# Altium schematic sheet Top_Level.SchDoc
size A4; SheetNumber: 1; SheetTotal: 7
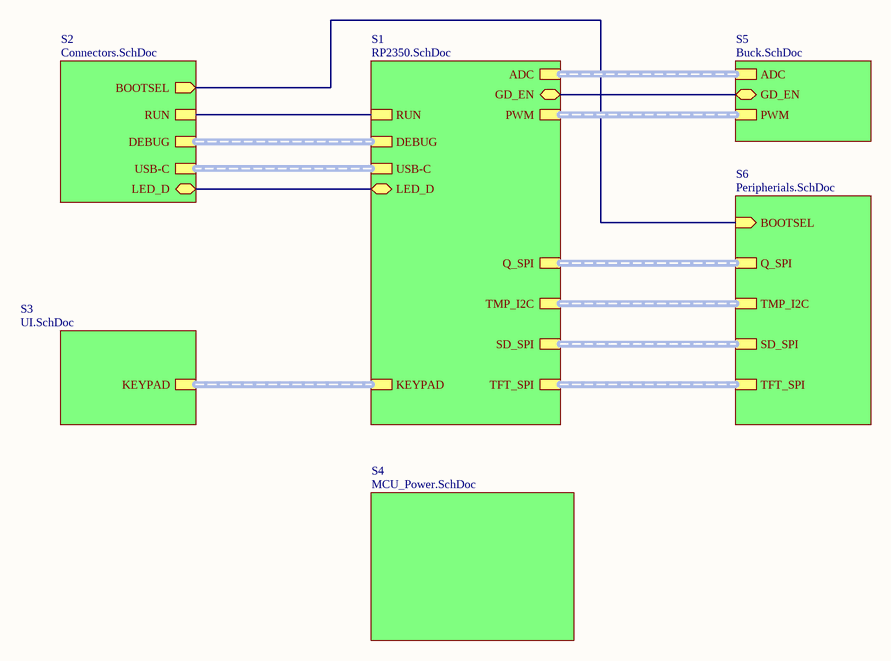
[diagram p0: Top_Level.SchDoc]

## Sub-sheets
S1 = RP2350.SchDoc: ADC (harness ADC), KEYPAD (harness KEYPAD), PWM (harness PWM), Q_SPI (harness Q_SPI), TMP_I2C (harness TMP_I2C), SD_SPI (harness SD_CARD), TFT_SPI (harness TFT_SPI), USB-C (harness USB-C), DEBUG (harness DEBUG), RUN, GD_EN (bidir), LED_D (bidir)
S2 = Connectors.SchDoc: USB-C (harness USB-C), DEBUG (harness DEBUG), RUN, BOOTSEL (out), LED_D (bidir)
S3 = UI.SchDoc: KEYPAD (harness KEYPAD)
S4 = MCU_Power.SchDoc: no entries
S5 = Buck.SchDoc: ADC (harness ADC), PWM (harness PWM), GD_EN (bidir)
S6 = Peripherials.SchDoc: BOOTSEL (in), TFT_SPI (harness TFT_SPI), SD_SPI (harness SD_CARD), TMP_I2C (harness TMP_I2C), Q_SPI (harness Q_SPI)

## Nets
(unnamed): sheet S1/RUN, sheet S2/RUN
(unnamed): sheet S1/GD_EN, sheet S5/GD_EN
(unnamed): sheet S1/LED_D, sheet S2/LED_D
(unnamed): sheet S2/BOOTSEL, sheet S6/BOOTSEL

## Buses and harness runs
harness sheet S1/ADC = sheet S5/ADC
harness sheet S1/DEBUG = sheet S2/DEBUG
harness sheet S1/KEYPAD = sheet S3/KEYPAD
harness sheet S1/PWM = sheet S5/PWM
harness sheet S1/Q_SPI = sheet S6/Q_SPI
harness sheet S1/SD_SPI = sheet S6/SD_SPI
harness sheet S1/TFT_SPI = sheet S6/TFT_SPI
harness sheet S1/TMP_I2C = sheet S6/TMP_I2C
harness sheet S1/USB-C = sheet S2/USB-C